# Altium project RheoBoard_V1.PrjPcb (part 3 of 5)
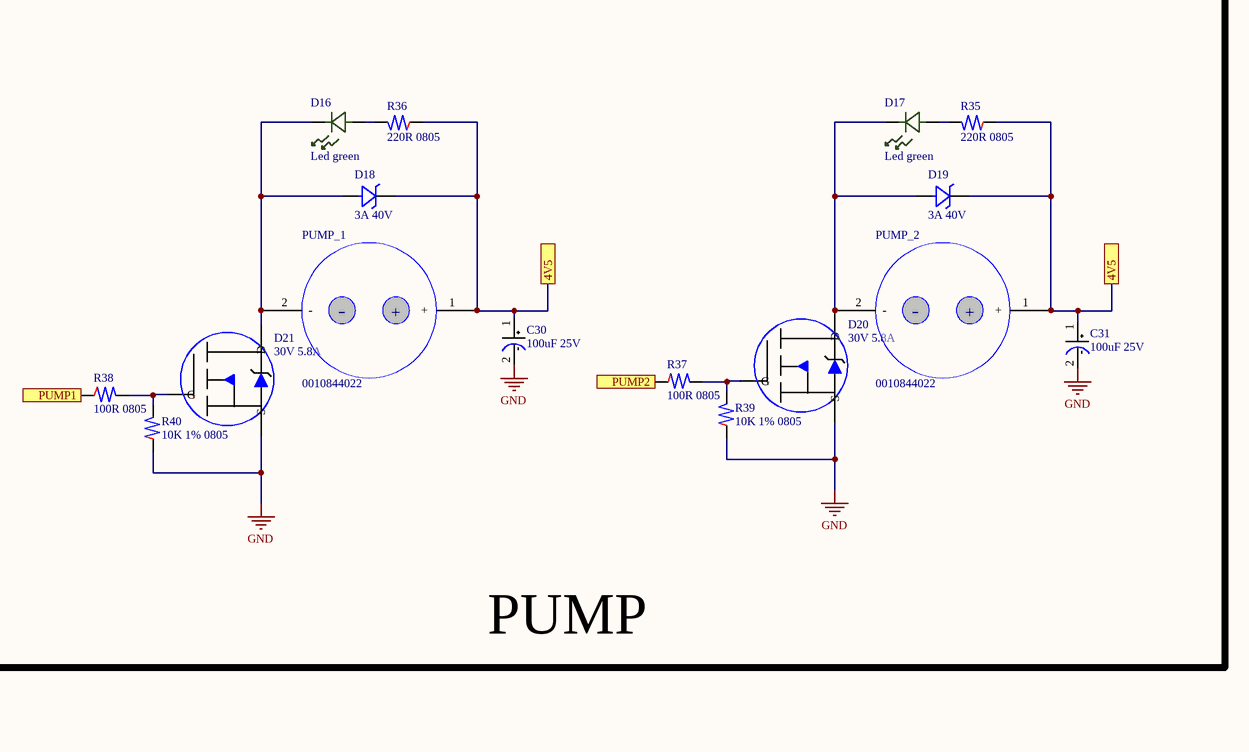
[diagram p12: MAIN.SchDoc, right]

## Sheet MAIN.SchDoc (continued)

### Library data of the parts (continued)
R31 R32 R37 R38 = RES_SMD 100 OHM 1% 1/8W 0805: Resistor Thick Film 0805 100 Ohm 1% 1/8W 100ppm/C Molded SMD Punched Carrier T/R; Manufacturer: Panasonic; Manufacturer Part Number: ERJ6ENF1000V; Manufacturer Lifecycle Status: ACTIVE; Manufacturer Package Identifier: 0805 (2012 metric); Part Series: Precision Thick Film Chip Resistors; Max Power Dissipation: 125mW; Resistance: 100Ω; Temperature Coefficient: 100ppm/°C; Voltage Rating: 150V; LIB MADE BY: MR HOANG; Supplier 1: DigiKey; RoHS: Compliant; Category: Chip SMD Resistors; Stock 1: 295478; Pricing 1: 1=0.12, 10=0.058, 25=0.0448, 50=0.0372, 100=0.0313, 250=0.02532, 500=0.02194, 1000=0.01927 (USD); Case/Package: 0805; Case Code (Imperial): 0805; China RoHS: Non-Compliant; Composition: Thick Film; Contact Plating: Tin; Depth: 1.25mm; Features: Automotive AEC-Q200; Height: 600µm; Lead Free: Lead Free; Length: 2mm; Lifecycle Status: Production; Max Operating Temperature: 155°C; Military Standard: Not; Min Operating Temperature: -55°C; Mount: Surface Mount; Number of Pins: 2; Number of Terminals: 2; Number of Terminations: 2; Packaging: Tape and Reel; Power Rating: 125mW; Radiation Hardening: No; Ratings: AEC-Q200; REACH SVHC: Yes; Schedule B: 8533210045, 8533210045|8533210045|8533210045|8533210045|8533210045|8533210045|8533210045|8533210045|8533210045, 8533210045|8533210045|8533210045|8533210045|8533210045|8533210045|8533210045|8533210045|8533210045|8533210045, 8533210045|8533210045|8533210045|8533210045|8533210045|8533210045|8533210045|8533210045|8533210045|8533210045|8533210045; Termination: SMD/SMT; Tolerance: 1%; Voltage Rating (DC): 150V; Width: 1.25mm; Working Voltage: 150V; ComponentLink1URL: https://datasheet.octopart.com:443/ERJ6ENF1000V-Panasonic-datasheet-82288794.pdf?src-supplier=Future+Electronics; ComponentLink1Description: https://datasheet.octopart.com:443/ERJ6ENF1000V-Panasonic-datasheet-82288794.pdf?src-supplier=Future+Electronics; ComponentLink2URL: https://datasheet.octopart.com:443/ERJ-6ENF1000V-Panasonic-datasheet-10025800.pdf?src-supplier=Future+Electronics; ComponentLink2Description: https://datasheet.octopart.com:443/ERJ-6ENF1000V-Panasonic-datasheet-10025800.pdf?src-supplier=Future+Electronics; ComponentLink3URL: https://datasheet.octopart.com:443/ERJ-6ENF1000V-Panasonic-datasheet-8853621.pdf?src-supplier=Future+Electronics; ComponentLink3Description: https://datasheet.octopart.com:443/ERJ-6ENF1000V-Panasonic-datasheet-8853621.pdf?src-supplier=Future+Electronics; ComponentLink4URL: https://datasheet.octopart.com:443/ERJ6ENF1000V-Panasonic-datasheet-48891056.pdf?src-supplier=Upverter; ComponentLink4Description: https://datasheet.octopart.com:443/ERJ6ENF1000V-Panasonic-datasheet-48891056.pdf?src-supplier=Upverter; ComponentLink5URL: https://datasheet.octopart.com:443/ERJ6ENF1000V-Panasonic-datasheet-13266541.pdf?src-supplier=element14+APAC; ComponentLink5Description: https://datasheet.octopart.com:443/ERJ6ENF1000V-Panasonic-datasheet-13266541.pdf?src-supplier=element14+APAC; ComponentLink6URL: https://datasheet.octopart.com:443/ERJ6ENF1000V-Panasonic-datasheet-5313456.pdf?src-supplier=Farnell; ComponentLink6Description: https://datasheet.octopart.com:443/ERJ6ENF1000V-Panasonic-datasheet-5313456.pdf?src-supplier=Farnell; ComponentLink7URL: https://datasheet.octopart.com:443/ERJ6ENF1000V-Panasonic-datasheet-136608610.pdf?src-supplier=Newark; ComponentLink7Description: https://datasheet.octopart.com:443/ERJ6ENF1000V-Panasonic-datasheet-136608610.pdf?src-supplier=Newark; ComponentLink8URL: https://datasheet.octopart.com:443/ERJ-6ENF1000V.-Panasonic-datasheet-182872238.pdf?src-supplier=Newark; ComponentLink8Description: https://datasheet.octopart.com:443/ERJ-6ENF1000V.-Panasonic-datasheet-182872238.pdf?src-supplier=Newark; ComponentLink9URL: https://datasheet.octopart.com:443/ERJ-6ENF1000V-Panasonic-datasheet-154766169.pdf?src-supplier=Master+Electronics; ComponentLink9Description: https://datasheet.octopart.com:443/ERJ-6ENF1000V-Panasonic-datasheet-154766169.pdf?src-supplier=Master+Electronics; ComponentLink10URL: https://datasheet.octopart.com:443/ERJ6ENF1000V-Panasonic-datasheet-138819429.pdf?src-supplier=Burklin+Elektronik; ComponentLink10Description: https://datasheet.octopart.com:443/ERJ6ENF1000V-Panasonic-datasheet-138819429.pdf?src-supplier=Burklin+Elektronik; ComponentLink11URL: https://datasheet.octopart.com/ERJ6ENF1000V-Panasonic-datasheet-78375410.pdf; ComponentLink11Description: https://datasheet.octopart.com/ERJ6ENF1000V-Panasonic-datasheet-78375410.pdf; ComponentLink12URL: https://datasheet.octopart.com:443/ERJ-6ENF1000V-Panasonic-datasheet-7269995.pdf?src-supplier=Jameco+(USA); ComponentLink12Description: https://datasheet.octopart.com:443/ERJ-6ENF1000V-Panasonic-datasheet-7269995.pdf?src-supplier=Jameco+(USA); ComponentLink13URL: https://datasheet.octopart.com:443/ERJ-6ENF1000V-Panasonic-datasheet-118621.pdf?src-supplier=DigiKey; ComponentLink13Description: https://datasheet.octopart.com:443/ERJ-6ENF1000V-Panasonic-datasheet-118621.pdf?src-supplier=DigiKey; ComponentLink14URL: https://datasheet.octopart.com:443/ERJ-6ENF1000V-Panasonic-datasheet-41391857.pdf?src-supplier=Electro+Sonic; ComponentLink14Description: https://datasheet.octopart.com:443/ERJ-6ENF1000V-Panasonic-datasheet-41391857.pdf?src-supplier=Electro+Sonic; LINK: https://www.lcsc.com/product-detail/C105577.html?s_z=n_q_RC0805FR-07100RL&spm=wm.fly.bg.0.xh&lcsc_vid=TlIIBF1XRVRWVwJWFFYIUAFRFVhYUgJWEQcPV1JURlgxVlNeQlVXV11RRVdcVzsOAxUeFF5JWBYZEEoKFBINSQcJGk4dAgUUFAk%3D; Supplier Part Number 1: P100CCT-ND
S1 = SENSOR 25PSIA 0.1" 24BIT: Board Mount Pressure Sensor -0.3V to 3.9V 0psi to 25psi Absolute 12-Pin T/R; Manufacturer: Honeywell; Accuracy: 0.25%; Current Rating: 1.7mA; Max Supply Voltage: 3.6V; Min Supply Voltage: 1.8V; Number of Bits: 14; Operating Supply Current: 33.8µA; Port Style: Barbless; LIB MADE BY: MR HOANG; Supplier 1: DigiKey; Manufacturer Part Number: MPRLS0025PA00001A; RoHS: Compliant; Category: Pressure Sensors; Stock 1: 700; Pricing 1: 700=14.11196 (USD); Case/Package: SMD/SMT; Height: 5.8mm; Length: 5mm; Lifecycle Status: Production; Max Operating Temperature: 85°C; Max Pressure: 25PSI; Min Operating Temperature: -40°C; Nominal Supply Current: 1.7mA; Schedule B: 8542390000, 9026200000, 9026200000|9026200000, 9026200000|9026200000|9026200000; Termination: Solder; ComponentLink1URL: https://datasheet.octopart.com:443/MPRLS0025PA00001A-Honeywell-datasheet-166035665.pdf?src-supplier=ODG+(Origin+Data+Global); ComponentLink1Description: https://datasheet.octopart.com:443/MPRLS0025PA00001A-Honeywell-datasheet-166035665.pdf?src-supplier=ODG+(Origin+Data+Global); ComponentLink2URL: https://datasheet.octopart.com:443/MPRLS0025PA00001A-Honeywell-datasheet-147661376.pdf?src-supplier=Upverter; ComponentLink2Description: https://datasheet.octopart.com:443/MPRLS0025PA00001A-Honeywell-datasheet-147661376.pdf?src-supplier=Upverter; ComponentLink3URL: https://datasheet.octopart.com:443/MPRLS0025PA00001A-Honeywell-datasheet-97324467.pdf?src-supplier=Sager+Electronics; ComponentLink3Description: https://datasheet.octopart.com:443/MPRLS0025PA00001A-Honeywell-datasheet-97324467.pdf?src-supplier=Sager+Electronics; ComponentLink4URL: https://datasheet.octopart.com:443/MPRLS0025PA00001A-Honeywell-datasheet-140701490.pdf?src-supplier=Sager+Electronics; ComponentLink4Description: https://datasheet.octopart.com:443/MPRLS0025PA00001A-Honeywell-datasheet-140701490.pdf?src-supplier=Sager+Electronics; ComponentLink5URL: https://datasheet.octopart.com:443/MPRLS0025PA00001A-Honeywell-datasheet-136492114.pdf?src-supplier=Master+Electronics; ComponentLink5Description: https://datasheet.octopart.com:443/MPRLS0025PA00001A-Honeywell-datasheet-136492114.pdf?src-supplier=Master+Electronics; ComponentLink6URL: https://datasheet.octopart.com:443/MPRLS0025PA00001A-Honeywell-datasheet-142341669.pdf?src-supplier=Honeywell; ComponentLink6Description: https://datasheet.octopart.com:443/MPRLS0025PA00001A-Honeywell-datasheet-142341669.pdf?src-supplier=Honeywell; ComponentLink7URL: https://datasheet.octopart.com:443/MPRLS0025PA00001A-Honeywell-datasheet-116854048.pdf?src-supplier=Honeywell; ComponentLink7Description: https://datasheet.octopart.com:443/MPRLS0025PA00001A-Honeywell-datasheet-116854048.pdf?src-supplier=Honeywell; ComponentLink8URL: https://datasheet.octopart.com:443/MPRLS0025PA00001A-Honeywell-datasheet-103078335.pdf?src-supplier=Honeywell; ComponentLink8Description: https://datasheet.octopart.com:443/MPRLS0025PA00001A-Honeywell-datasheet-103078335.pdf?src-supplier=Honeywell; ComponentLink9URL: https://sigma.octopart.com:443/103078336/instruction_sheet/Honeywell-MPRLS0025PA00001A.pdf?src-supplier=Honeywell; ComponentLink9Description: https://sigma.octopart.com:443/103078336/instruction_sheet/Honeywell-MPRLS0025PA00001A.pdf?src-supplier=Honeywell; ComponentLink10URL: https://sigma.octopart.com:443/102925452/instruction_sheet/Honeywell-MPRLS0025PA00001A.pdf?src-supplier=Honeywell; ComponentLink10Description: https://sigma.octopart.com:443/102925452/instruction_sheet/Honeywell-MPRLS0025PA00001A.pdf?src-supplier=Honeywell; ComponentLink11URL: https://datasheet.octopart.com:443/MPRLS0025PA00001A-Honeywell-datasheet-101670856.pdf?src-supplier=Honeywell; ComponentLink11Description: https://datasheet.octopart.com:443/MPRLS0025PA00001A-Honeywell-datasheet-101670856.pdf?src-supplier=Honeywell; ComponentLink12URL: https://sigma.octopart.com:443/97324468/instruction_sheet/Honeywell-MPRLS0025PA00001A.pdf?src-supplier=Honeywell; ComponentLink12Description: https://sigma.octopart.com:443/97324468/instruction_sheet/Honeywell-MPRLS0025PA00001A.pdf?src-supplier=Honeywell; ComponentLink13URL: https://datasheet.octopart.com:443/MPRLS0025PA00001A-Honeywell-datasheet-151108213.pdf?src-supplier=Electro+Sonic; ComponentLink13Description: https://datasheet.octopart.com:443/MPRLS0025PA00001A-Honeywell-datasheet-151108213.pdf?src-supplier=Electro+Sonic; ComponentLink14URL: https://datasheet.octopart.com:443/MPRLS0025PA00001A-Honeywell-datasheet-159777480.pdf?src-supplier=RS+(Formerly+Allied+Electronics); ComponentLink14Description: https://datasheet.octopart.com:443/MPRLS0025PA00001A-Honeywell-datasheet-159777480.pdf?src-supplier=RS+(Formerly+Allied+Electronics); ComponentLink15URL: https://datasheet.octopart.com:443/MPRLS0025PA00001A-Honeywell-datasheet-138697059.pdf?src-supplier=TME; ComponentLink15Description: https://datasheet.octopart.com:443/MPRLS0025PA00001A-Honeywell-datasheet-138697059.pdf?src-supplier=TME; ComponentLink16URL: https://datasheet.octopart.com:443/MPRLS0025PA00001A-Honeywell-datasheet-135974584.pdf?src-supplier=TME; ComponentLink16Description: https://datasheet.octopart.com:443/MPRLS0025PA00001A-Honeywell-datasheet-135974584.pdf?src-supplier=TME; ComponentLink17URL: http://sigma.octopart.com:80/conflict_mineral_statement/Honeywell-company-50.pdf?src-supplier=Compliance+Statements; ComponentLink17Description: http://sigma.octopart.com:80/conflict_mineral_statement/Honeywell-company-50.pdf?src-supplier=Compliance+Statements; Supplier Part Number 1: 480-7098-2-ND; LINK: https://www.lcsc.com/product-detail/C3257154.html?s_z=n_q_t_MPRLS0025PA00001A&spm=wm.fly.bg.0.xh___wm.ssy.tc.0.tz&lcsc_vid=FlMMUgJST1FcAwECRwALVlxQQAdaX1xfRFUPAlJUQFExVlNeT1lZUl1eTlBcVDsOAxUeFF5JWBYZEEoKFBINSQcJGk4MFQUIE0wKAhAHHg1BVlVWWQkaCgg%3D
SW1-SW4 = SWITCH TACTILE SPST-NO 0.05A 24V: Switch Tactile N.O. SPST Flat Round Button PC Pins 0.05A 24VDC 0.98N Thru-Hole Bag; Manufacturer: Omron; Actuator Length: 900µm; Contact Current Rating: 50mA; Contact Resistance: 100mΩ; Electrical Life: 1Mcycles; Illumination Type: Illuminated, Non-Illuminated; Max Voltage Rating (DC): 24V; Number of Poles: 1; Operating Force: 1.27N; Switch Function: Off-Mom; Switch Travel: 250µm; LIB MADE BY: MR HOANG; Supplier 1: Verical; Manufacturer Part Number: B3F-1020; RoHS: Compliant; Category: Tactile Switches; Stock 1: 648; Pricing 1: 159=0.516, 250=0.4953, 500=0.4774 (USD); Color: Black; Contact Material: Gold, Silver; Contact Plating: Silver; Current Rating: 50mA; Depth: 6mm; Export Control Classification Number (ECCN) Code: EAR99; Height: 3.4mm; Harmonized Tariff Schedule (HTS) Code: 8536.50.90.40; Insulation Resistance: 100MΩ; Introduction Date: 1999-01-01; Lead Free: Lead Free; Length: 6mm; Lifecycle Status: Production; Max Current Rating: 50mA; Max Operating Temperature: 70°C; Mechanical Life: 1Mcycles; Min Operating Temperature: -25°C; Mount: DIP; Number of Positions: 1; Packaging: Bulk; REACH SVHC: Unaffected; Termination: Solder; Throw Configuration: SPST; Voltage Rating (DC): 24V; Weight: 250mg; Width: 6mm; ComponentLink1URL: https://datasheet.octopart.com:443/B3F-1020-Omron-datasheet-10910152.pdf?src-supplier=Omron; ComponentLink1Description: https://datasheet.octopart.com:443/B3F-1020-Omron-datasheet-10910152.pdf?src-supplier=Omron; ComponentLink2URL: https://datasheet.octopart.com:443/B3F-1020-Omron-datasheet-179667965.pdf?src-supplier=IHS; ComponentLink2Description: https://datasheet.octopart.com:443/B3F-1020-Omron-datasheet-179667965.pdf?src-supplier=IHS; ComponentLink3URL: https://datasheet.octopart.com:443/B3F-1020-Omron-datasheet-62106907.pdf?src-supplier=Master+Electronics; ComponentLink3Description: https://datasheet.octopart.com:443/B3F-1020-Omron-datasheet-62106907.pdf?src-supplier=Master+Electronics; ComponentLink4URL: https://datasheet.octopart.com:443/B3F-1020-Omron-datasheet-14713915.pdf?src-supplier=Farnell; ComponentLink4Description: https://datasheet.octopart.com:443/B3F-1020-Omron-datasheet-14713915.pdf?src-supplier=Farnell; ComponentLink5URL: https://datasheet.octopart.com:443/B3F-1020-Omron-datasheet-5318198.pdf?src-supplier=Sager+Electronics; ComponentLink5Description: https://datasheet.octopart.com:443/B3F-1020-Omron-datasheet-5318198.pdf?src-supplier=Sager+Electronics; ComponentLink6URL: https://datasheet.octopart.com:443/B3F-1020-Omron-datasheet-8815213.pdf?src-supplier=Newark; ComponentLink6Description: https://datasheet.octopart.com:443/B3F-1020-Omron-datasheet-8815213.pdf?src-supplier=Newark; ComponentLink7URL: https://datasheet.octopart.com:443/B3F-1020-Omron-datasheet-11778577.pdf?src-supplier=Arrow+Electronics; ComponentLink7Description: https://datasheet.octopart.com:443/B3F-1020-Omron-datasheet-11778577.pdf?src-supplier=Arrow+Electronics; ComponentLink8URL: https://datasheet.octopart.com:443/B3F-1020-Omron-datasheet-5319362.pdf?src-supplier=Verical; ComponentLink8Description: https://datasheet.octopart.com:443/B3F-1020-Omron-datasheet-5319362.pdf?src-supplier=Verical; ComponentLink9URL: https://datasheet.octopart.com:443/B3F-1020-Omron-datasheet-134074.pdf?src-supplier=DigiKey; ComponentLink9Description: https://datasheet.octopart.com:443/B3F-1020-Omron-datasheet-134074.pdf?src-supplier=DigiKey; ComponentLink10URL: https://datasheet.octopart.com:443/B3F-1020-Omron-datasheet-54411.pdf?src-supplier=RS+(Formerly+Allied+Electronics); ComponentLink10Description: https://datasheet.octopart.com:443/B3F-1020-Omron-datasheet-54411.pdf?src-supplier=RS+(Formerly+Allied+Electronics); ComponentLink11URL: https://datasheet.octopart.com:443/B3F-1020-Omron-datasheet-9586142.pdf?src-supplier=RS+(Formerly+Allied+Electronics); ComponentLink11Description: https://datasheet.octopart.com:443/B3F-1020-Omron-datasheet-9586142.pdf?src-supplier=RS+(Formerly+Allied+Electronics); LINK: http://shopee.vn/C%C3%B4ng-t%E1%BA%AFc-Janpanomronswitch-B3F-1020-ki%E1%BB%83u-Nh%E1%BA%ADt-B%E1%BA%A3n-i.558568108.13735169249; Supplier Part Number 1: B3F1020
TP1 TP2 = PC TEST POINT MINIATURE WHITE: Test Point, Mini, Thm, Pc, .300 L, .100 Od, Heat Resistant Nylon 46, White; Manufacturer: Keystone; Body Material: Bronze, PBT; Hole Diameter: 1.6mm; Inside Diameter: 1.27mm; Insulation: Insulated; Number of Ports: 1; Outside Diameter: 2.54mm; Plating: Silver; LIB MADE BY: MR HOANG; Supplier 1: DigiKey; Manufacturer Part Number: 5002; RoHS: Compliant; Category: Test Points; Stock 1: 831319; Pricing 1: 1=0.25, 10=0.19, 2500=0.16, 5000=0.14 (USD); China RoHS: Compliant; Color: White; Contact Material: Silver; Contact Plating: Tin; Country of Origin: Mainland China; Export Control Classification Number (ECCN) Code: EAR99; Flammability Rating: UL94 V-0; Height: 4.57mm; Housing Color: White; Introduction Date: 1995-10-01; Lead Free: Lead Free; Length: 7.62mm; Lifecycle Status: Production; Material: Bronze, Nylon, Silver; Mount: PCB, Through Hole; Orientation: Straight; Packaging: Bulk; REACH SVHC: Yes; ComponentLink1URL: https://datasheet.octopart.com:443/5002-Keystone-datasheet-138896739.pdf?src-supplier=Upverter; ComponentLink1Description: https://datasheet.octopart.com:443/5002-Keystone-datasheet-138896739.pdf?src-supplier=Upverter; ComponentLink2URL: https://datasheet.octopart.com:443/5002-Keystone-datasheet-15716159.pdf?src-supplier=IHS; ComponentLink2Description: https://datasheet.octopart.com:443/5002-Keystone-datasheet-15716159.pdf?src-supplier=IHS; ComponentLink3URL: https://datasheet.octopart.com:443/5002-Keystone-datasheet-23674.pdf?src-supplier=element14; ComponentLink3Description: https://datasheet.octopart.com:443/5002-Keystone-datasheet-23674.pdf?src-supplier=element14; ComponentLink4URL: https://datasheet.octopart.com:443/5002-Keystone-datasheet-60278094.pdf?src-supplier=LKR; ComponentLink4Description: https://datasheet.octopart.com:443/5002-Keystone-datasheet-60278094.pdf?src-supplier=LKR; ComponentLink5URL: https://datasheet.octopart.com:443/5002-Keystone-datasheet-9590016.pdf?src-supplier=Sager+Electronics; ComponentLink5Description: https://datasheet.octopart.com:443/5002-Keystone-datasheet-9590016.pdf?src-supplier=Sager+Electronics; ComponentLink6URL: https://datasheet.octopart.com:443/5002-Keystone-datasheet-10925273.pdf?src-supplier=RS+(Formerly+Allied+Electronics); ComponentLink6Description: https://datasheet.octopart.com:443/5002-Keystone-datasheet-10925273.pdf?src-supplier=RS+(Formerly+Allied+Electronics); ComponentLink7URL: https://datasheet.octopart.com:443/5002-Keystone-datasheet-6528.pdf?src-supplier=RS+(Formerly+Allied+Electronics); ComponentLink7Description: https://datasheet.octopart.com:443/5002-Keystone-datasheet-6528.pdf?src-supplier=RS+(Formerly+Allied+Electronics); ComponentLink8URL: https://datasheet.octopart.com:443/5002-Keystone-datasheet-15983577.pdf?src-supplier=element14+APAC; ComponentLink8Description: https://datasheet.octopart.com:443/5002-Keystone-datasheet-15983577.pdf?src-supplier=element14+APAC; ComponentLink9URL: https://datasheet.octopart.com:443/5002-Keystone-datasheet-549598.pdf?src-supplier=Future+Electronics; ComponentLink9Description: https://datasheet.octopart.com:443/5002-Keystone-datasheet-549598.pdf?src-supplier=Future+Electronics; ComponentLink10URL: https://datasheet.octopart.com:443/5002-Keystone-datasheet-542585.pdf?src-supplier=Future+Electronics; ComponentLink10Description: https://datasheet.octopart.com:443/5002-Keystone-datasheet-542585.pdf?src-supplier=Future+Electronics; ComponentLink11URL: https://datasheet.octopart.com:443/5002-Keystone-datasheet-7266429.pdf?src-supplier=Jameco+(USA); ComponentLink11Description: https://datasheet.octopart.com:443/5002-Keystone-datasheet-7266429.pdf?src-supplier=Jameco+(USA); Supplier Part Number 1: 36-5002-ND; LINK: https://linhkien.cxtvn.com/8661-5002-pc-test-point-miniature-white.html
U1 = IC LED DRVR LIN PWM 25MA 28TSSOP: PCA9685 Series 5.5V 25 mA 1 MHz 12-bit PWM Fm+I2C-Bus LED Controller - TSSOP-28; Manufacturer: NXP Semiconductors; Frequency: 25MHz; High Level Output Current: 10mA; Low Level Output Current: 400A; Max Power Dissipation: 400mW; Min Supply Voltage: 2.3V; Nominal Supply Current: 6mA; Nominal Supply Voltage (DC): 3V; Number of Characters: 16; Number of Circuits: 1; Output Current: 25mA; Output Voltage: 5V; Power Dissipation: 400W; LIB MADE BY: MR HOANG; Supplier 1: DigiKey; Manufacturer Part Number: PCA9685PW,118; RoHS: Compliant; Category: LED Drivers; Stock 1: 14623; Pricing 1: 1=3.94, 10=2.975, 25=2.7336, 100=2.4678, 250=2.34116, 500=2.32544 (USD); Ambient Temperature Range High: 85°C; Case/Package: TSSOP; China RoHS: Compliant; Dimming: PWM; Export Control Classification Number (ECCN) Code: EAR99; Height: 1.1mm; Height - Seated (Max): 1.1mm; Harmonized Tariff Schedule (HTS) Code: 8542.39.00.01; Introduction Date: 2008-07-25; Lead Free: Lead Free; Length: 9.7mm; Lifecycle Status: Production; Max Operating Temperature: 85°C; Max Supply Current: 10mA; Max Supply Voltage: 5.5V; Min Operating Temperature: -40°C; Mount: Surface Mount; Number of Outputs: 16; Number of Pins: 28; Number of Terminals: 28; Output Current per Channel: 25mA; Packaging: Tape and Reel; Radiation Hardening: No; REACH SVHC: Unaffected; Schedule B: 8542390000, 8542390000|8542390000|8542390000|8542390000|8542390000; Temperature Grade: Industrial; Terminal Pitch: 650µm; Width: 4.4mm; ComponentLink1URL: https://datasheet.octopart.com:443/PCA9685PW%2C118-NXP-Semiconductors-datasheet-82522728.pdf?src-supplier=Newark; ComponentLink1Description: https://datasheet.octopart.com:443/PCA9685PW%2C118-NXP-Semiconductors-datasheet-82522728.pdf?src-supplier=Newark; ComponentLink2URL: https://sigma.octopart.com:443/138897933/technical_drawing/NXP-Semiconductors-PCA9685PW%2C118.pdf?src-supplier=Upverter; ComponentLink2Description: https://sigma.octopart.com:443/138897933/technical_drawing/NXP-Semiconductors-PCA9685PW%2C118.pdf?src-supplier=Upverter; ComponentLink3URL: https://datasheet.octopart.com:443/PCA9685PW%2C118-NXP-Semiconductors-datasheet-10031291.pdf?src-supplier=Upverter; ComponentLink3Description: https://datasheet.octopart.com:443/PCA9685PW%2C118-NXP-Semiconductors-datasheet-10031291.pdf?src-supplier=Upverter; ComponentLink4URL: https://datasheet.octopart.com:443/PCA9685PW%2C118-NXP-Semiconductors-datasheet-17019746.pdf?src-supplier=SHENGYU+ELECTRONICS; ComponentLink4Description: https://datasheet.octopart.com:443/PCA9685PW%2C118-NXP-Semiconductors-datasheet-17019746.pdf?src-supplier=SHENGYU+ELECTRONICS; ComponentLink5URL: https://datasheet.octopart.com:443/PCA9685PW%2C118-NXP-datasheet-8329821.pdf?src-supplier=Verical; ComponentLink5Description: https://datasheet.octopart.com:443/PCA9685PW%2C118-NXP-datasheet-8329821.pdf?src-supplier=Verical; ComponentLink6URL: http://sigma.octopart.com:80/reach_statement/NXP-Semiconductors-company-13.pdf?src-supplier=Compliance+Statements; ComponentLink6Description: http://sigma.octopart.com:80/reach_statement/NXP-Semiconductors-company-13.pdf?src-supplier=Compliance+Statements; ComponentLink7URL: http://sigma.octopart.com:80/rohs_statement/NXP-Semiconductors-company-12.pdf?src-supplier=Compliance+Statements; ComponentLink7Description: http://sigma.octopart.com:80/rohs_statement/NXP-Semiconductors-company-12.pdf?src-supplier=Compliance+Statements; Supplier Part Number 1: 568-11925-6-ND; LINK: https://www.lcsc.com/product-detail/C2678753.html?s_z=n_q_PCA9685PW%252C118&spm=wm.fly.bg.0.xh&lcsc_vid=FlMMUgJST1FcAwECRwALVlxQQAdaX1xfRFUPAlJUQFExVlNeTlFfVVNURVhaVjsOAxUeFF5JWBYZEEoKFBINSQcJGk4MFQUIE0wKAhAHHg1BVlVWWQkaCgg%3D
VALE_1 VALE_2 = 6V Air Valve with 2-pin JST XH Connector - FA0520E: Connector Header 2 Position 6.35mm Solder Straight Thru-Hole 2 Terminal 1 Port MLX-Series; Manufacturer: Molex; Manufacturer Lifecycle Status: ACTIVE; Connector Type: Power; Contact Resistance: 3.5mΩ; Current Rating: 13.5A; Dielectric Material: Polyester; Gender: Female; Glow Wire Compliant: Non-compliant; Insulation Resistance: 1GΩ; Number of Circuits: 2; Operating Force: 6.672N; Plating: Tin; Plating Thickness: 3.5052µm; Ratings: CSA; Voltage Rating: 600V; LIB MADE BY: MR HOANG; Supplier 1: DigiKey; Manufacturer Part Number: 10-84-4022; RoHS: Compliant; Category: Headers and Wire Housings; Stock 1: 11507; Pricing 1: 1=0.51, 10=0.436, 100=0.3706, 500=0.33078, 1836=0.30175, 5508=0.27924, 11016=0.26592 (USD); China RoHS: Compliant; Color: Natural; Contact Gender: Female; Contact Material: Bronze; Contact Plating: Tin; Country of Origin: US; Export Control Classification Number (ECCN) Code: EAR99; Flammability Rating: UL94 V-2; Halogen Free: Low Halogen; Housing Material: Nylon; Harmonized Tariff Schedule (HTS) Code: 8536.69.40.30; Introduction Date: 1994-12-01; Lead Free: Lead Free; Lifecycle Status: Production; Max Operating Temperature: 105°C; Min Operating Temperature: -55°C; Mount: Through Hole; Number of Contacts: 2; Number of Pins: 2; Number of Positions: 2; Number of Rows: 1; Orientation: Vertical; Packaging: Carton; Pitch: 6.35mm; Radiation Hardening: No; REACH SVHC: Unaffected; Schedule B: 8536694040, 8536694040|8536694040|8536694040|8536694040|8536694040; Shell Material: POLYAMIDE66; Terminal Pitch: 6.35mm; Termination: Solder; ComponentLink1URL: https://datasheet.octopart.com:443/10-84-4022-Molex-datasheet-137053637.pdf?src-supplier=element14+APAC; ComponentLink1Description: https://datasheet.octopart.com:443/10-84-4022-Molex-datasheet-137053637.pdf?src-supplier=element14+APAC; ComponentLink2URL: https://datasheet.octopart.com:443/10-84-4022-Molex-datasheet-13791970.pdf?src-supplier=Molex; ComponentLink2Description: https://datasheet.octopart.com:443/10-84-4022-Molex-datasheet-13791970.pdf?src-supplier=Molex; ComponentLink3URL: https://sigma.octopart.com:443/16272272/technical_drawing/Molex-10-84-4022.pdf?src-supplier=Molex; ComponentLink3Description: https://sigma.octopart.com:443/16272272/technical_drawing/Molex-10-84-4022.pdf?src-supplier=Molex; ComponentLink4URL: https://datasheet.octopart.com:443/010844022-Molex-datasheet-5390850.pdf?src-supplier=Molex; ComponentLink4Description: https://datasheet.octopart.com:443/010844022-Molex-datasheet-5390850.pdf?src-supplier=Molex; ComponentLink5URL: https://datasheet.octopart.com:443/10-84-4022-Molex-datasheet-193058052.pdf?src-supplier=JRH+Electronics; ComponentLink5Description: https://datasheet.octopart.com:443/10-84-4022-Molex-datasheet-193058052.pdf?src-supplier=JRH+Electronics; ComponentLink6URL: https://datasheet.octopart.com:443/10-84-4022-Molex-datasheet-154742841.pdf?src-supplier=JRH+Electronics; ComponentLink6Description: https://datasheet.octopart.com:443/10-84-4022-Molex-datasheet-154742841.pdf?src-supplier=JRH+Electronics; ComponentLink7URL: https://datasheet.octopart.com:443/10-84-4022-Molex-datasheet-33343972.pdf?src-supplier=Electro+Sonic; ComponentLink7Description: https://datasheet.octopart.com:443/10-84-4022-Molex-datasheet-33343972.pdf?src-supplier=Electro+Sonic; ComponentLink8URL: https://datasheet.octopart.com:443/10-84-4022-Molex-datasheet-21205596.pdf?src-supplier=Electro+Sonic; ComponentLink8Description: https://datasheet.octopart.com:443/10-84-4022-Molex-datasheet-21205596.pdf?src-supplier=Electro+Sonic; ComponentLink9URL: https://datasheet.octopart.com:443/10-84-4022-Molex-datasheet-62102692.pdf?src-supplier=Electro+Sonic; ComponentLink9Description: https://datasheet.octopart.com:443/10-84-4022-Molex-datasheet-62102692.pdf?src-supplier=Electro+Sonic; ComponentLink10URL: https://datasheet.octopart.com:443/10-84-4022-Molex-datasheet-140174504.pdf?src-supplier=RS+(Formerly+Allied+Electronics); ComponentLink10Description: https://datasheet.octopart.com:443/10-84-4022-Molex-datasheet-140174504.pdf?src-supplier=RS+(Formerly+Allied+Electronics); ComponentLink11URL: https://datasheet.octopart.com:443/10-84-4022-Molex-datasheet-120134962.pdf?src-supplier=RS+(Formerly+Allied+Electronics); ComponentLink11Description: https://datasheet.octopart.com:443/10-84-4022-Molex-datasheet-120134962.pdf?src-supplier=RS+(Formerly+Allied+Electronics); ComponentLink12URL: https://datasheet.octopart.com:443/10-84-4022-Molex-datasheet-32867450.pdf?src-supplier=Newark; ComponentLink12Description: https://datasheet.octopart.com:443/10-84-4022-Molex-datasheet-32867450.pdf?src-supplier=Newark; ComponentLink13URL: https://datasheet.octopart.com:443/10844022-Molex-datasheet-8320017.pdf?src-supplier=Jameco+(USA); ComponentLink13Description: https://datasheet.octopart.com:443/10844022-Molex-datasheet-8320017.pdf?src-supplier=Jameco+(USA); ComponentLink14URL: https://datasheet.octopart.com:443/10-84-4022-Molex-datasheet-5314522.pdf?src-supplier=Verical; ComponentLink14Description: https://datasheet.octopart.com:443/10-84-4022-Molex-datasheet-5314522.pdf?src-supplier=Verical; ComponentLink15URL: https://datasheet.octopart.com:443/10-84-4022-Molex-datasheet-27226.pdf?src-supplier=DigiKey; ComponentLink15Description: https://datasheet.octopart.com:443/10-84-4022-Molex-datasheet-27226.pdf?src-supplier=DigiKey; ComponentLink16URL: http://sigma.octopart.com:80/16272275/rohs_statement/Molex-10-84-4022.pdf?src-supplier=Compliance+Statements; ComponentLink16Description: http://sigma.octopart.com:80/16272275/rohs_statement/Molex-10-84-4022.pdf?src-supplier=Compliance+Statements; ComponentLink17URL: http://sigma.octopart.com:80/reach_statement/Molex-company-74.pdf?src-supplier=Compliance+Statements; ComponentLink17Description: http://sigma.octopart.com:80/reach_statement/Molex-company-74.pdf?src-supplier=Compliance+Statements; ComponentLink18URL: http://sigma.octopart.com:80/rohs_statement/Molex-company-73.pdf?src-supplier=Compliance+Statements; ComponentLink18Description: http://sigma.octopart.com:80/rohs_statement/Molex-company-73.pdf?src-supplier=Compliance+Statements; ComponentLink19URL: http://sigma.octopart.com:80/conflict_mineral_statement/Molex-company-72.pdf?src-supplier=Compliance+Statements; ComponentLink19Description: http://sigma.octopart.com:80/conflict_mineral_statement/Molex-company-72.pdf?src-supplier=Compliance+Statements; Supplier Part Number 1: WM1263-ND; LINK: https://www.lcsc.com/product-detail/C6955946.html?s_z=n_q_p_0010844022&spm=wm.ssy.bg.0.xh&lcsc_vid=FlMMUgJST1FcAwECRwALVlxQQAdaX1xfRFUPAlJUQFExVlNeTlFaV1NTRVlYVTsOAxUeFF5JWBYZEEoKFBINSQcJGk4MFQUIE0wKAhAHHg1BVlVWWQkaCgg%3D

## Sheet POWER.SchDoc
size A2; SheetNumber: 3; SheetTotal: 3
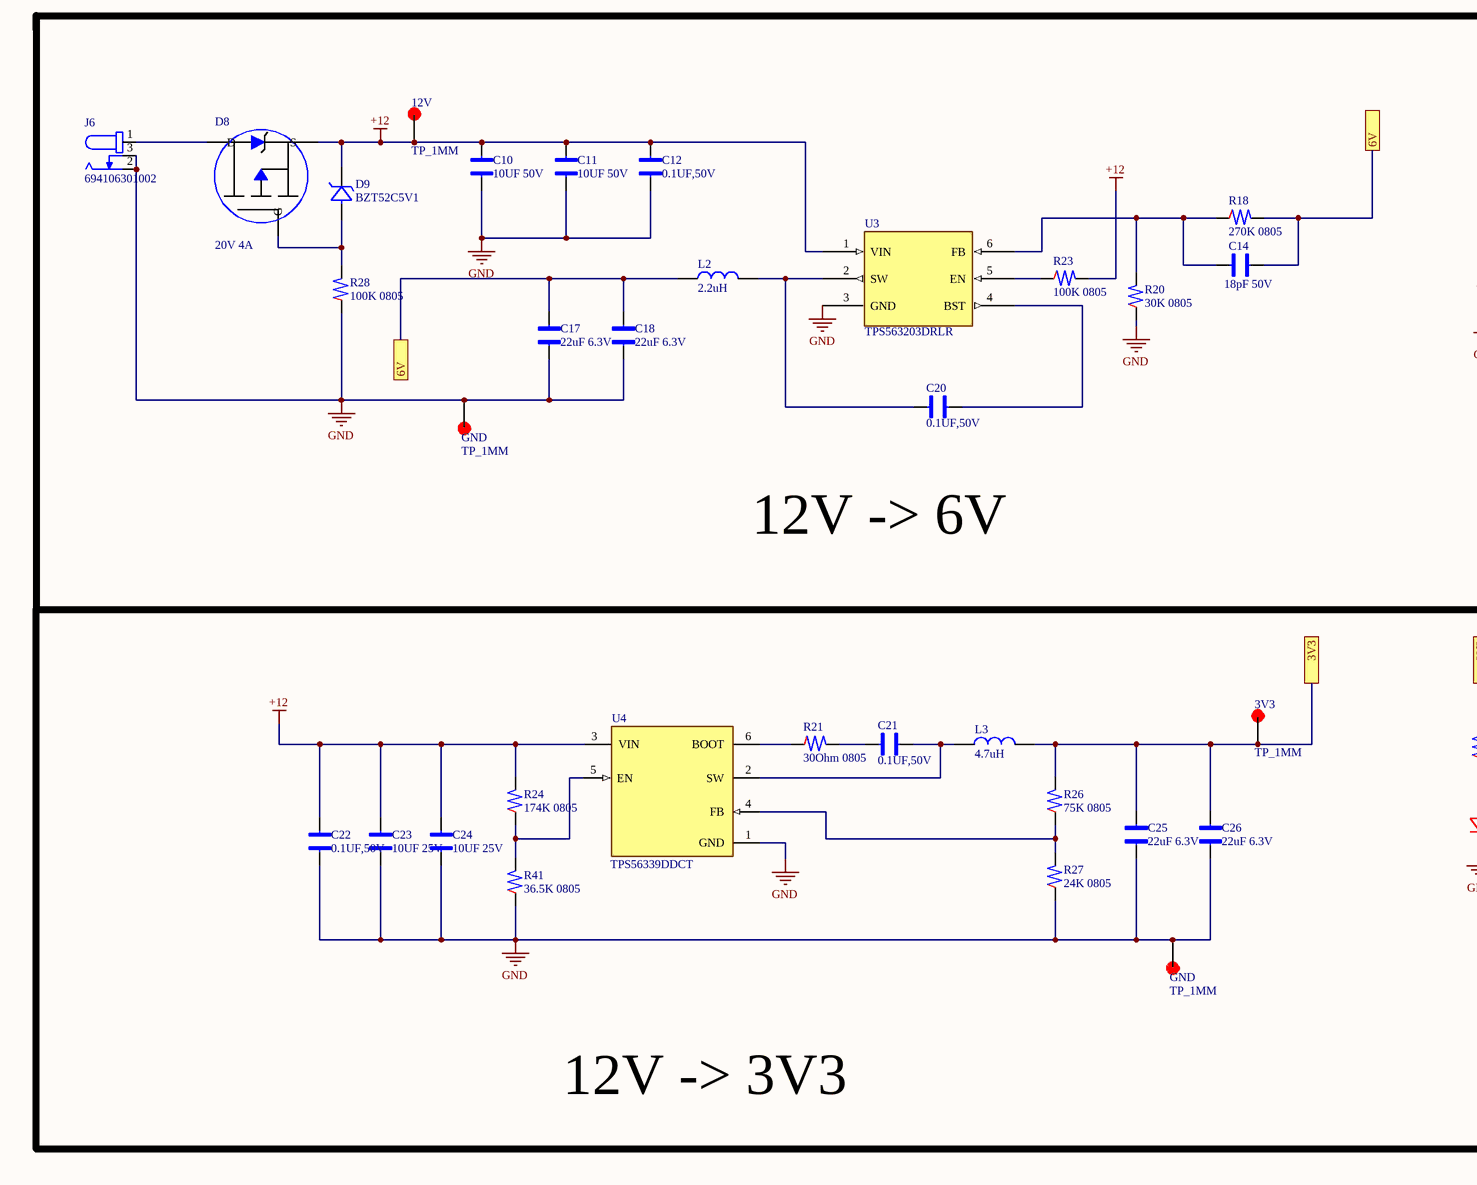
[diagram p9: POWER.SchDoc, left]
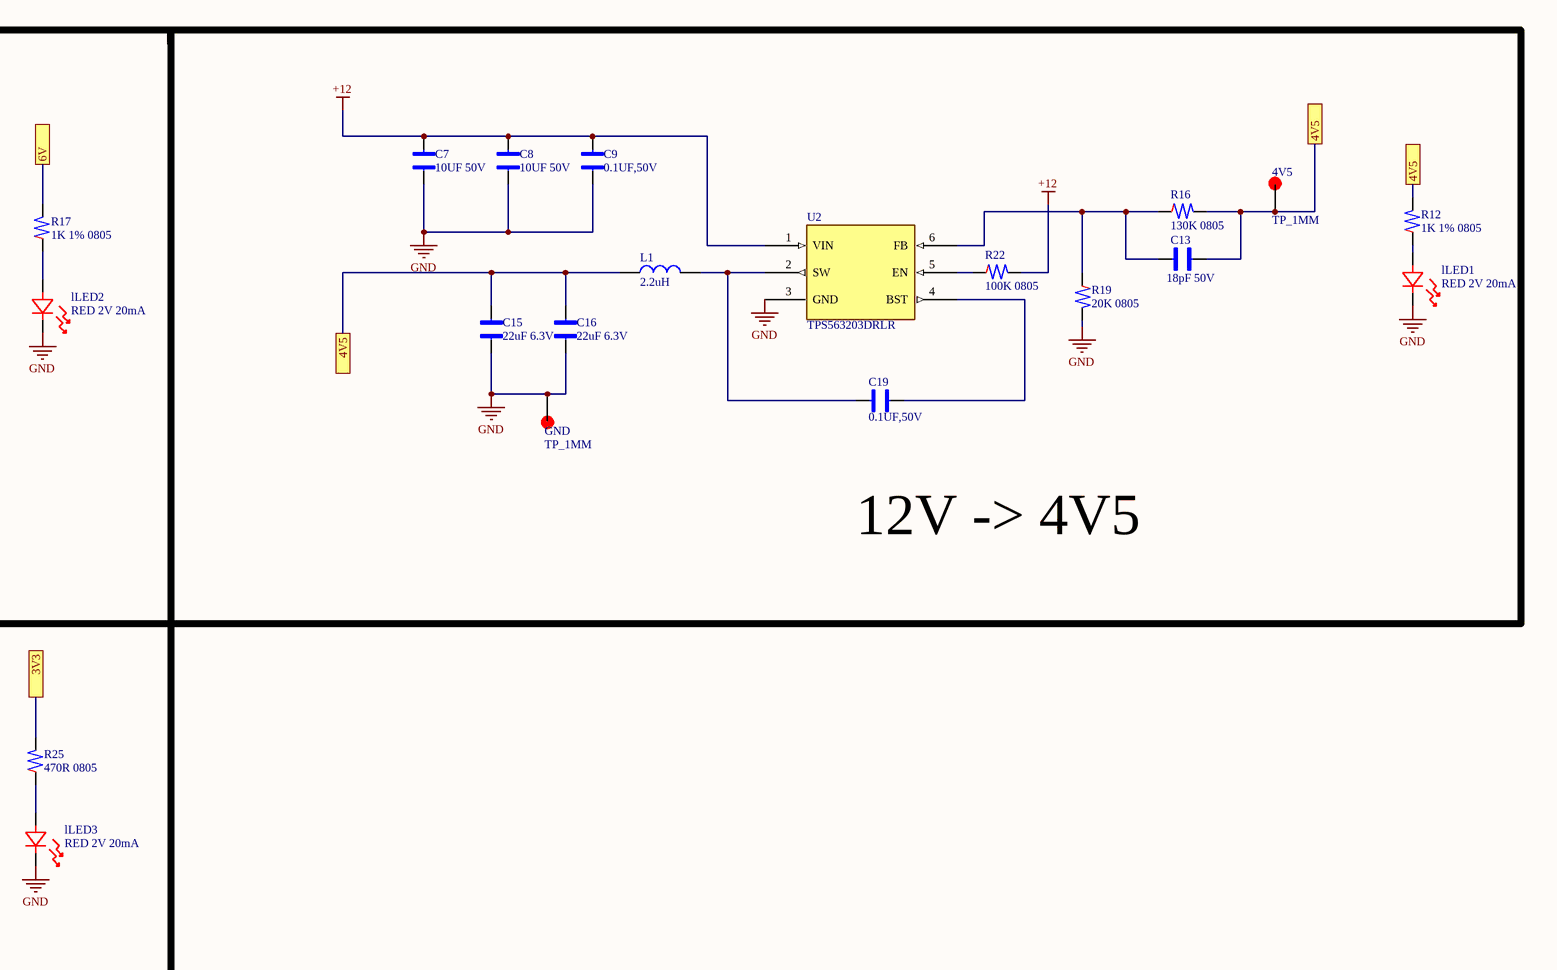
[diagram p10: POWER.SchDoc, right]

### Parts
(Parts that share a designator on the sheet are numbered #1, #2 ... from top to bottom, then left to right.)
3V3  TP_1MM  [TP_1mm]
4V5  TP_1MM  [TP_1mm]
12V  TP_1MM  [TP_1mm]
C7  10UF 50V  [CAP_CER_0805]
C8  10UF 50V  [CAP_CER_0805]
C9  0.1UF,50V  [CAP_CER_0805]
C10  10UF 50V  [CAP_CER_0805]
C11  10UF 50V  [CAP_CER_0805]
C12  0.1UF,50V  [CAP_CER_0805]
C13  18pF 50V  [CAP_CER_0805]
C14  18pF 50V  [CAP_CER_0805]
C15  22uF 6.3V  [CAP_CER_0603]
C16  22uF 6.3V  [CAP_CER_0603]
C17  22uF 6.3V  [CAP_CER_0603]
C18  22uF 6.3V  [CAP_CER_0603]
C19  0.1UF,50V  [CAP_CER_0805]
C20  0.1UF,50V  [CAP_CER_0805]
C21  0.1UF,50V  [CAP_CER_0805]
C22  0.1UF,50V  [CAP_CER_0805]
C23  10UF 25V  [CAP_CER_0805]
C24  10UF 25V  [CAP_CER_0805]
C25  22uF 6.3V  [CAP_CER_0603]
C26  22uF 6.3V  [CAP_CER_0603]
D8  20V 4A  [SOT-23-3]
D9  BZT52C5V1  [SOD-123]
GND#1  TP_1MM  [TP_1mm]
GND#2  TP_1MM  [TP_1mm]
GND#3  TP_1MM  [TP_1mm]
J6  694106301002  [CONN PWR JACK 2.1X5.5MM SOLDER]
L1  2.2uH  [IND_12.5x12.5_H8.5]
L2  2.2uH  [IND_12.5x12.5_H8.5]
L3  4.7uH  [IND_6.8X6.5_H2.8]
lLED1  RED 2V 20mA  [LED_LS R976_AOS]
lLED2  RED 2V 20mA  [LED_LS R976_AOS]
lLED3  RED 2V 20mA  [LED_LS R976_AOS]
R12  1K 1% 0805  [RES_0805]
R16  130K 0805  [RES_0805]
R17  1K 1% 0805  [RES_0805]
R18  270K 0805  [RES_0805]
R19  20K 0805  [RES_0805]
R20  30K 0805  [RES_0805]
R21  30Ohm 0805  [RES_0805]
R22  100K 0805  [RES_0805]
R23  100K 0805  [RES_0805]
R24  174K 0805  [RES_0805]
R25  470R 0805  [RES_0805]
R26  75K 0805  [RES_0805]
R27  24K 0805  [RES_0805]
R28  100K 0805  [RES_0805]
R41  36.5K 0805  [RES_0805]
U2  TPS563203DRLR  [SOT-563]
U3  TPS563203DRLR  [SOT-563]
U4  TPS56339DDCT  [SOT-23-6]

### Blocks framed on the sheet
12V -> 3V3: 3V3 C21-C26 GND#3 L3 lLED3 R21 R24-R27 R41 U4

### Ports
3V3, 4V5, 6V

### Nets
+12: 12V.1 C7.2 C8.2 C9.2 C10.2 C11.2 C12.2 C22.2 C23.2 C24.2 D8.2(S) D9.1(CATHODE) R22.2 R23.2 R24.2 U2.1(VIN) U3.1(VIN) U4.3(VIN)
GND: C7.1 C8.1 C9.1 C10.1 C11.1 C12.1 C15.1 C16.1 C17.1 C18.1 C22.1 C23.1 C24.1 C25.1 C26.1 GND#1.1 GND#2.1 GND#3.1 J6.2 J6.3 lLED1.1 lLED2.1 lLED3.1 R19.2 R20.1 R27.1 R28.1 R41.1 U2.3(GND) U3.3(GND) U4.1(GND)
Net3V3_1: 3V3.1 C25.2 C26.2 L3.2 R25.2 R26.2 ; port 3V3
Net4V5_1: 4V5.1 C13.2 C15.2 C16.2 L1.1 R12.2 R16.2 ; port 4V5
NetC13_1: C13.1 R16.1 R19.1 U2.6(FB)
NetC14_1: C14.1 R18.1 R20.2 U3.6(FB)
NetC14_2: C14.2 C17.2 C18.2 L2.1 R17.2 R18.2 ; port 6V
NetC19_1: C19.1 L1.2 U2.2(SW)
NetC19_2: C19.2 U2.4(BST)
NetC20_1: C20.1 L2.2 U3.2(SW)
NetC20_2: C20.2 U3.4(BST)
NetC21_1: C21.1 L3.1 U4.2(SW)
NetC21_2: C21.2 R21.2
NetD8_1: D8.1(G) D9.2(ANODE) R28.2
NetD8_3: D8.3(D) J6.1
NetlLED1_2: lLED1.2 R12.1
NetlLED2_2: lLED2.2 R17.1
NetlLED3_2: lLED3.2 R25.1
NetR21_1: R21.1 U4.6(BOOT)
NetR22_1: R22.1 U2.5(EN)
NetR23_1: R23.1 U3.5(EN)
NetR24_1: R24.1 R41.2 U4.5(EN)
NetR26_1: R26.1 R27.2 U4.4(FB)

### Notes on the sheet
- 12V -> 6V
- 12V -> 4V5